# Altium schematic sheet channels_1.schdoc
size 400 x 299 mm; Device: default420x319; Symbol: default420x319; Name: default420x319; Size: "User"; Id: /; File: channels_1; Sheet: /
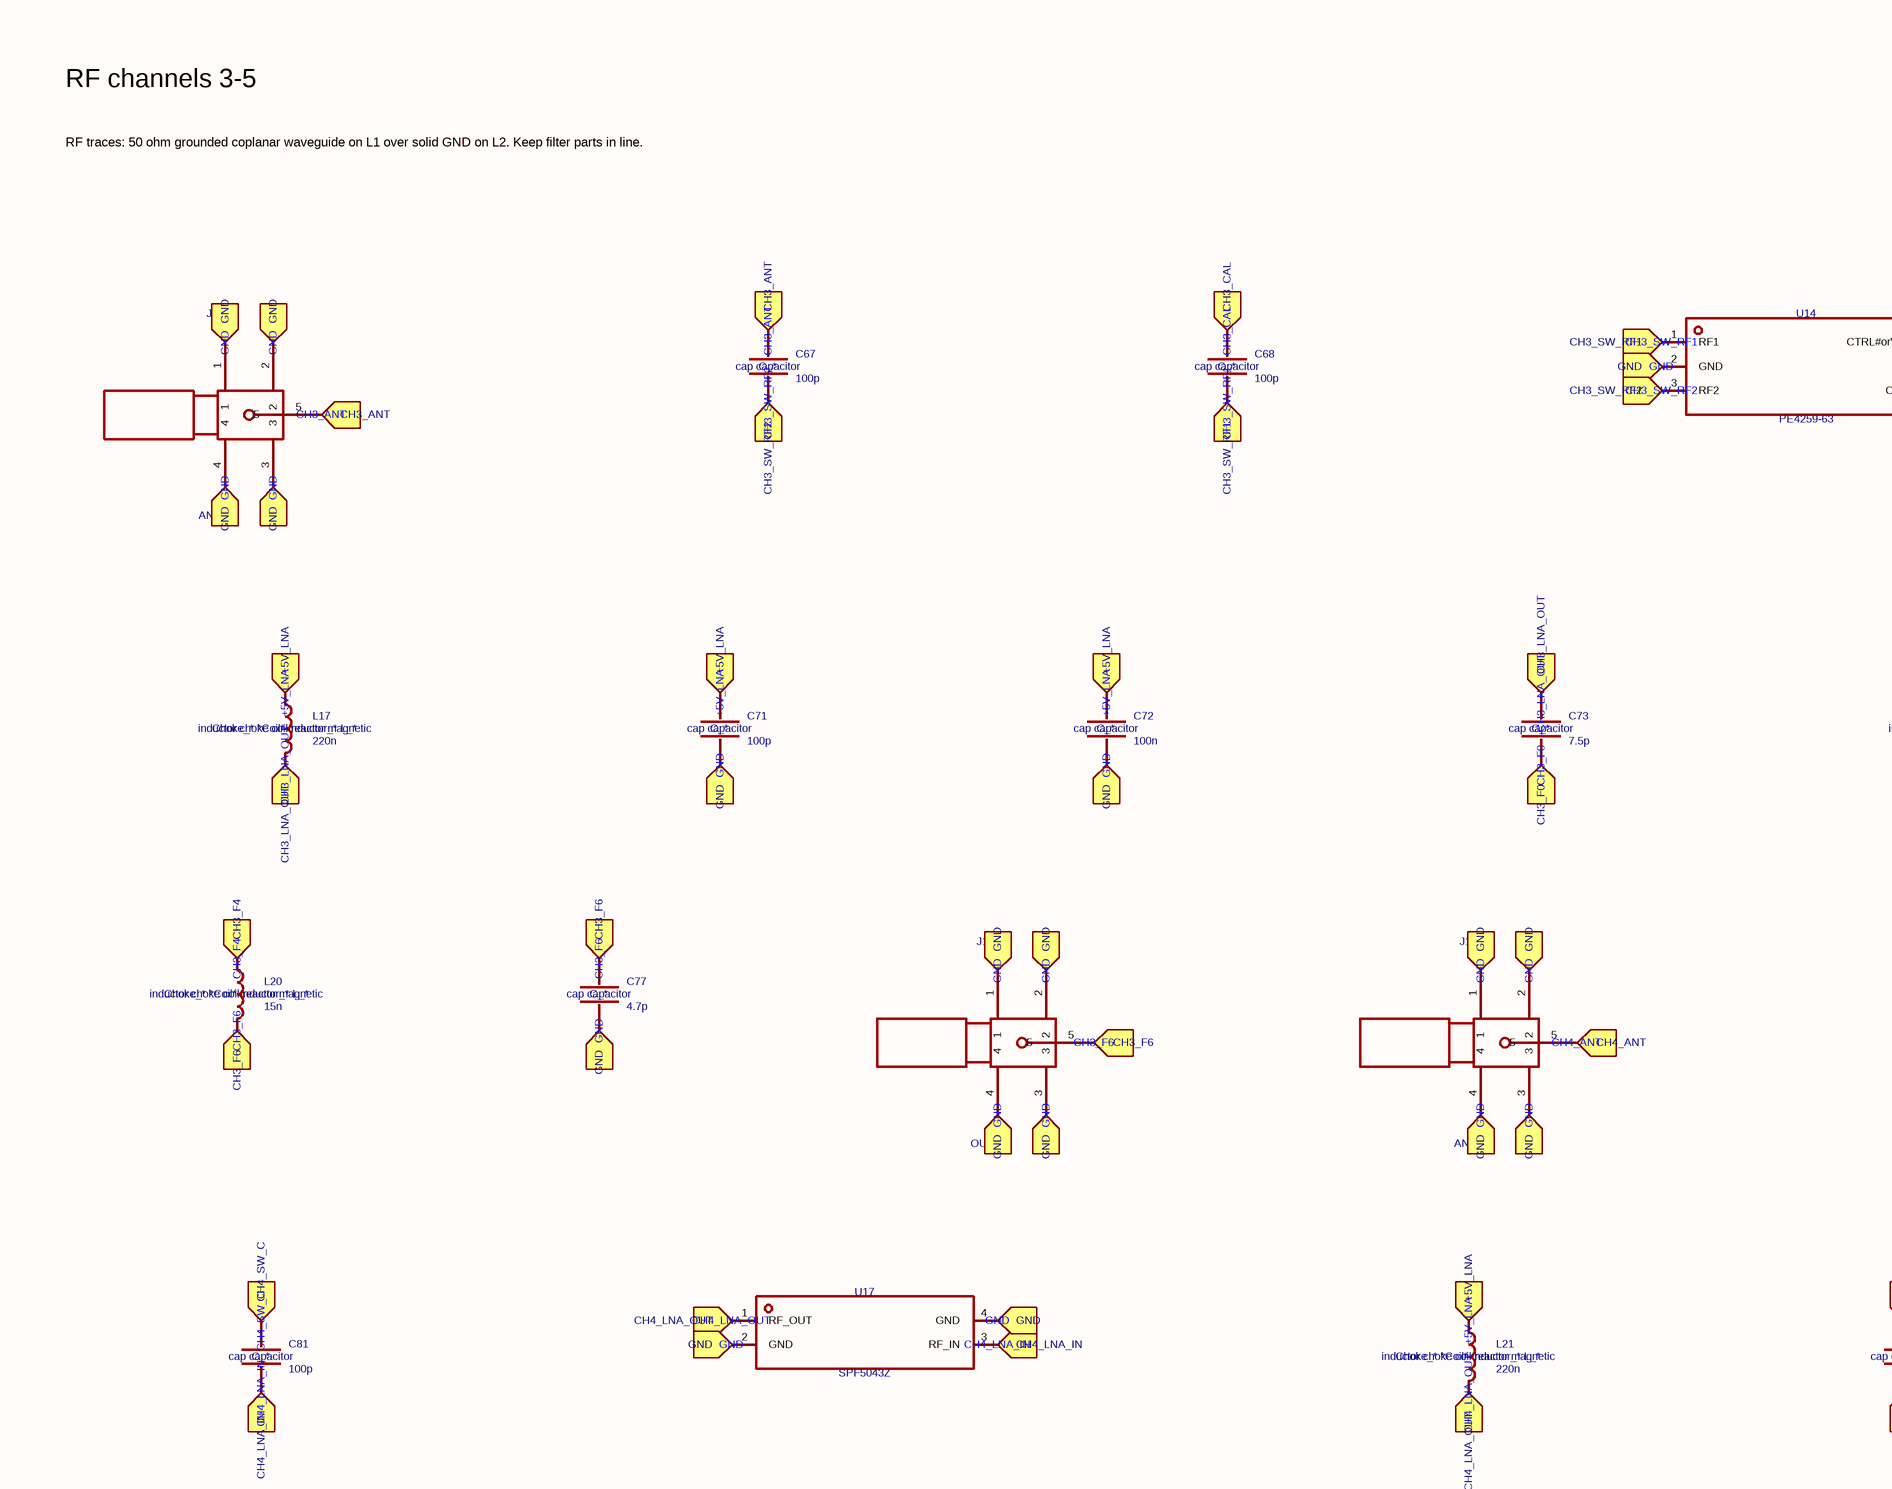
[diagram p0: channels_1.schdoc, top left]
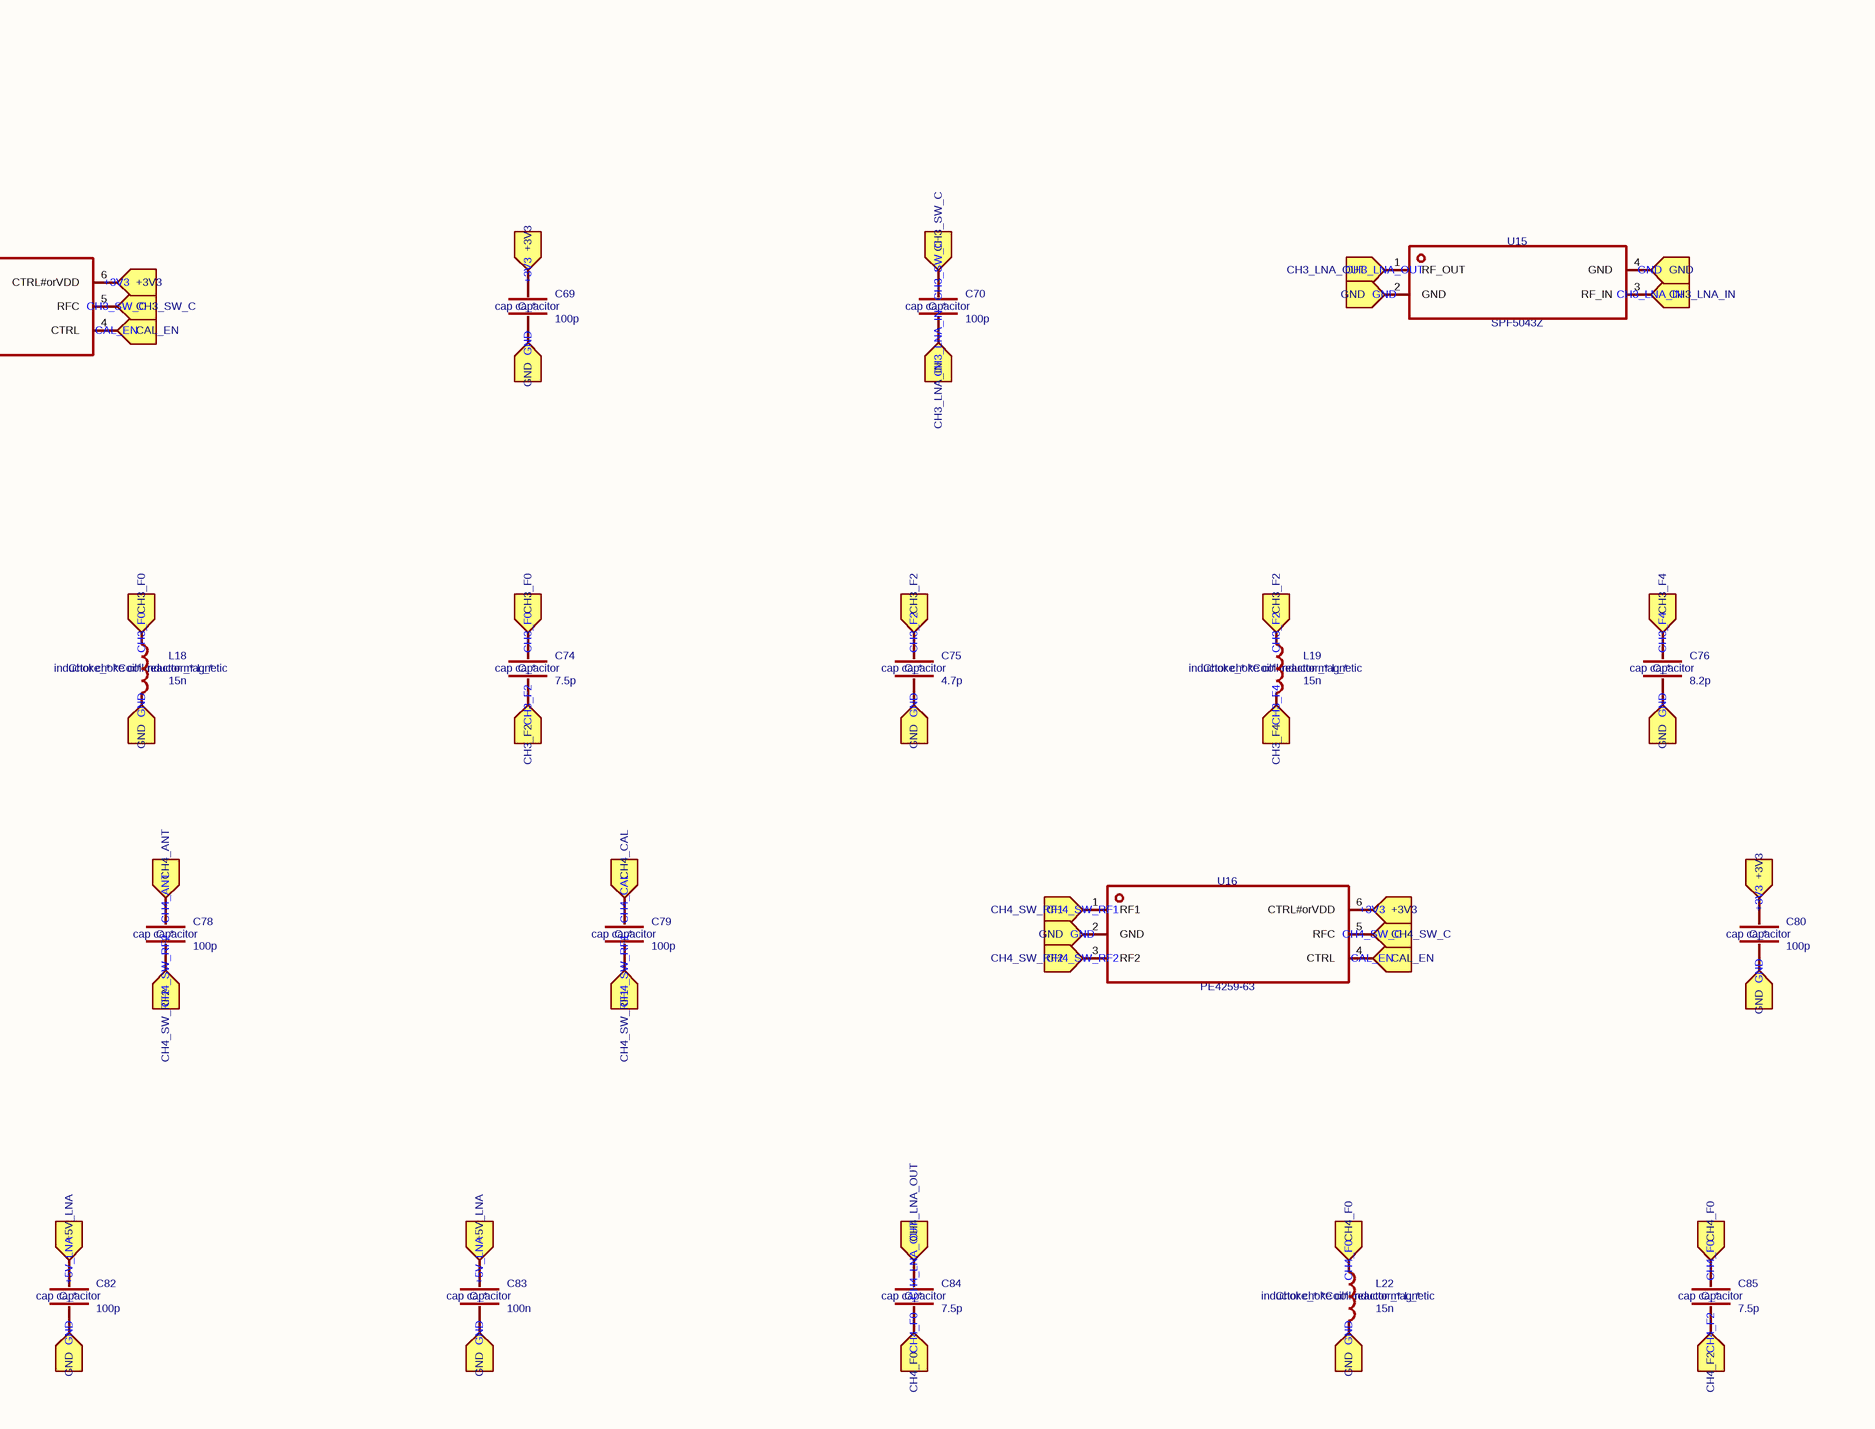
[diagram p1: channels_1.schdoc, top right]
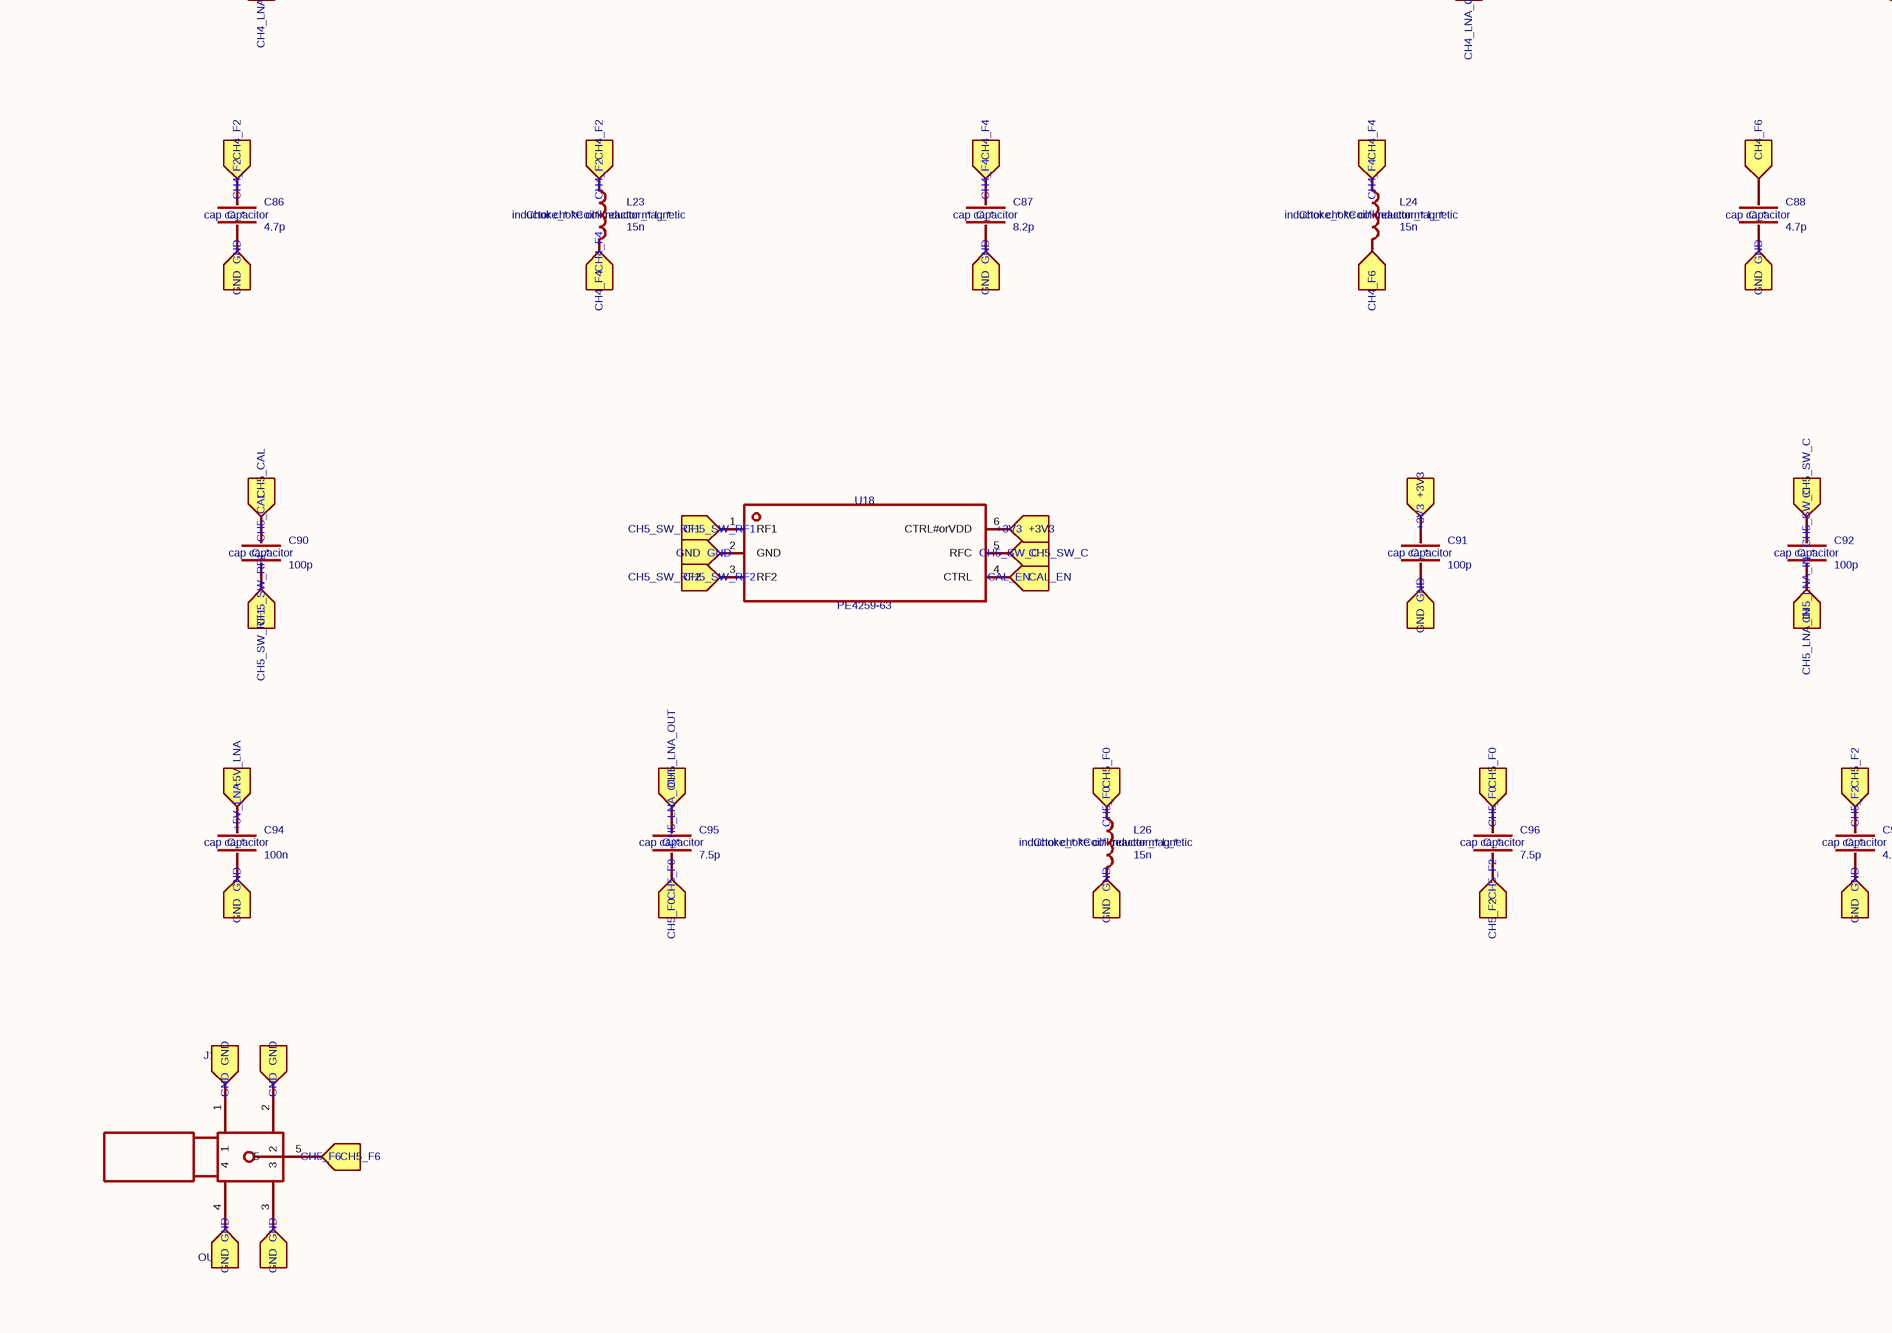
[diagram p2: channels_1.schdoc, bottom left]
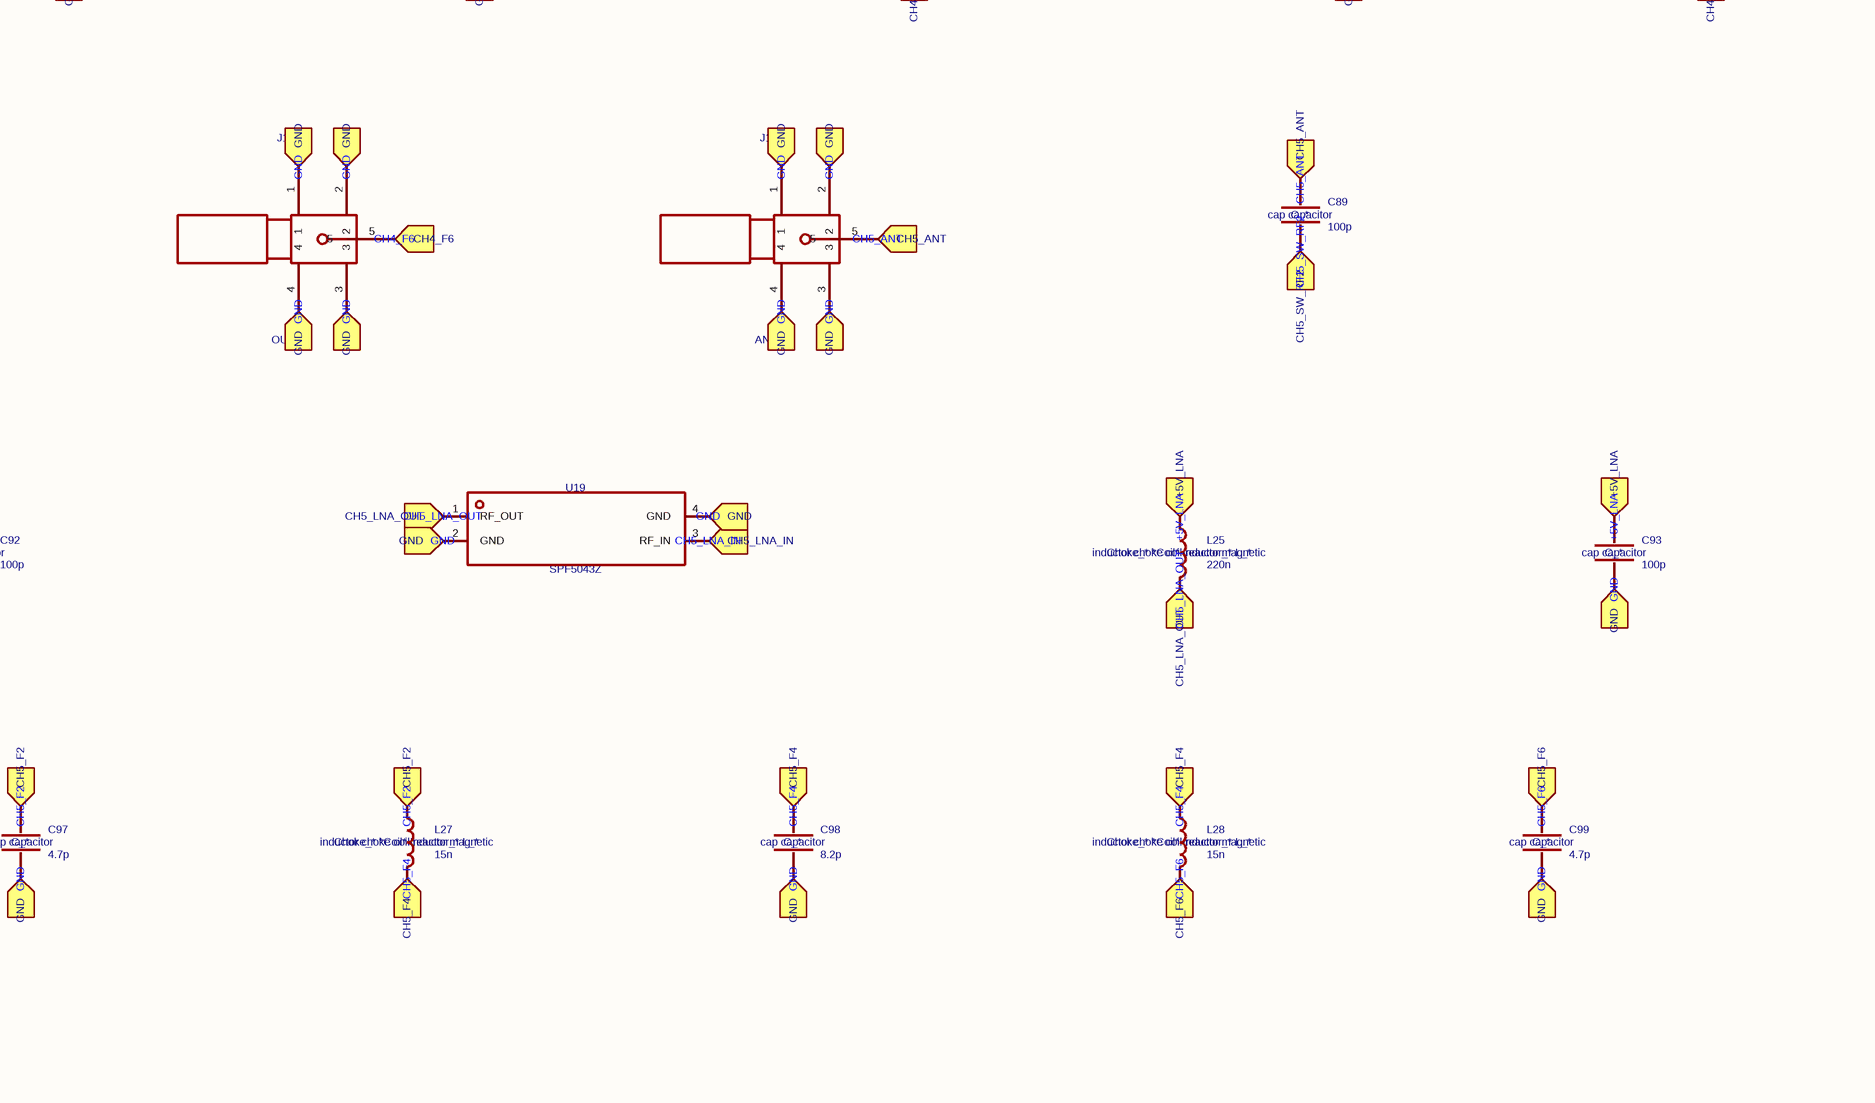
[diagram p3: channels_1.schdoc, bottom right]

## Parts
C67  value 100p  ki_keywords: cap capacitor  ki_fp_filters: C_*  [Capacitor_SMD:C_0402_1005Metric]  (hidden comment: Device_C)
C68  value 100p  ki_keywords: cap capacitor  ki_fp_filters: C_*  [Capacitor_SMD:C_0402_1005Metric]  (hidden comment: Device_C)
C69  value 100p  ki_keywords: cap capacitor  ki_fp_filters: C_*  [Capacitor_SMD:C_0402_1005Metric]  (hidden comment: Device_C)
C70  value 100p  ki_keywords: cap capacitor  ki_fp_filters: C_*  [Capacitor_SMD:C_0402_1005Metric]  (hidden comment: Device_C)
C71  value 100p  ki_keywords: cap capacitor  ki_fp_filters: C_*  [Capacitor_SMD:C_0402_1005Metric]  (hidden comment: Device_C)
C72  value 100n  ki_keywords: cap capacitor  ki_fp_filters: C_*  [Capacitor_SMD:C_0402_1005Metric]  (hidden comment: Device_C)
C73  value 7.5p  ki_keywords: cap capacitor  ki_fp_filters: C_*  [Capacitor_SMD:C_0402_1005Metric]  (hidden comment: Device_C)
C74  value 7.5p  ki_keywords: cap capacitor  ki_fp_filters: C_*  [Capacitor_SMD:C_0402_1005Metric]  (hidden comment: Device_C)
C75  value 4.7p  ki_keywords: cap capacitor  ki_fp_filters: C_*  [Capacitor_SMD:C_0402_1005Metric]  (hidden comment: Device_C)
C76  value 8.2p  ki_keywords: cap capacitor  ki_fp_filters: C_*  [Capacitor_SMD:C_0402_1005Metric]  (hidden comment: Device_C)
C77  value 4.7p  ki_keywords: cap capacitor  ki_fp_filters: C_*  [Capacitor_SMD:C_0402_1005Metric]  (hidden comment: Device_C)
C78  value 100p  ki_keywords: cap capacitor  ki_fp_filters: C_*  [Capacitor_SMD:C_0402_1005Metric]  (hidden comment: Device_C)
C79  value 100p  ki_keywords: cap capacitor  ki_fp_filters: C_*  [Capacitor_SMD:C_0402_1005Metric]  (hidden comment: Device_C)
C80  value 100p  ki_keywords: cap capacitor  ki_fp_filters: C_*  [Capacitor_SMD:C_0402_1005Metric]  (hidden comment: Device_C)
C81  value 100p  ki_keywords: cap capacitor  ki_fp_filters: C_*  [Capacitor_SMD:C_0402_1005Metric]  (hidden comment: Device_C)
C82  value 100p  ki_keywords: cap capacitor  ki_fp_filters: C_*  [Capacitor_SMD:C_0402_1005Metric]  (hidden comment: Device_C)
C83  value 100n  ki_keywords: cap capacitor  ki_fp_filters: C_*  [Capacitor_SMD:C_0402_1005Metric]  (hidden comment: Device_C)
C84  value 7.5p  ki_keywords: cap capacitor  ki_fp_filters: C_*  [Capacitor_SMD:C_0402_1005Metric]  (hidden comment: Device_C)
C85  value 7.5p  ki_keywords: cap capacitor  ki_fp_filters: C_*  [Capacitor_SMD:C_0402_1005Metric]  (hidden comment: Device_C)
C86  value 4.7p  ki_keywords: cap capacitor  ki_fp_filters: C_*  [Capacitor_SMD:C_0402_1005Metric]  (hidden comment: Device_C)
C87  value 8.2p  ki_keywords: cap capacitor  ki_fp_filters: C_*  [Capacitor_SMD:C_0402_1005Metric]  (hidden comment: Device_C)
C88  value 4.7p  ki_keywords: cap capacitor  ki_fp_filters: C_*  [Capacitor_SMD:C_0402_1005Metric]  (hidden comment: Device_C)
C89  value 100p  ki_keywords: cap capacitor  ki_fp_filters: C_*  [Capacitor_SMD:C_0402_1005Metric]  (hidden comment: Device_C)
C90  value 100p  ki_keywords: cap capacitor  ki_fp_filters: C_*  [Capacitor_SMD:C_0402_1005Metric]  (hidden comment: Device_C)
C91  value 100p  ki_keywords: cap capacitor  ki_fp_filters: C_*  [Capacitor_SMD:C_0402_1005Metric]  (hidden comment: Device_C)
C92  value 100p  ki_keywords: cap capacitor  ki_fp_filters: C_*  [Capacitor_SMD:C_0402_1005Metric]  (hidden comment: Device_C)
C93  value 100p  ki_keywords: cap capacitor  ki_fp_filters: C_*  [Capacitor_SMD:C_0402_1005Metric]  (hidden comment: Device_C)
C94  value 100n  ki_keywords: cap capacitor  ki_fp_filters: C_*  [Capacitor_SMD:C_0402_1005Metric]  (hidden comment: Device_C)
C95  value 7.5p  ki_keywords: cap capacitor  ki_fp_filters: C_*  [Capacitor_SMD:C_0402_1005Metric]  (hidden comment: Device_C)
C96  value 7.5p  ki_keywords: cap capacitor  ki_fp_filters: C_*  [Capacitor_SMD:C_0402_1005Metric]  (hidden comment: Device_C)
C97  value 4.7p  ki_keywords: cap capacitor  ki_fp_filters: C_*  [Capacitor_SMD:C_0402_1005Metric]  (hidden comment: Device_C)
C98  value 8.2p  ki_keywords: cap capacitor  ki_fp_filters: C_*  [Capacitor_SMD:C_0402_1005Metric]  (hidden comment: Device_C)
C99  value 4.7p  ki_keywords: cap capacitor  ki_fp_filters: C_*  [Capacitor_SMD:C_0402_1005Metric]  (hidden comment: Device_C)
J9  value ANT3  [prc:SMA-TH_BWSMA-KE-Z001]  (hidden comment: prc_BWSMA-KE-Z001)
J10  value OUT3  [prc:SMA-TH_BWSMA-KE-Z001]  (hidden comment: prc_BWSMA-KE-Z001)
J11  value ANT4  [prc:SMA-TH_BWSMA-KE-Z001]  (hidden comment: prc_BWSMA-KE-Z001)
J12  value OUT4  [prc:SMA-TH_BWSMA-KE-Z001]  (hidden comment: prc_BWSMA-KE-Z001)
J13  value ANT5  [prc:SMA-TH_BWSMA-KE-Z001]  (hidden comment: prc_BWSMA-KE-Z001)
J14  value OUT5  [prc:SMA-TH_BWSMA-KE-Z001]  (hidden comment: prc_BWSMA-KE-Z001)
L17  value 220n  ki_keywords: inductor choke coil reactor magnetic  ki_fp_filters: Choke_* *Coil* Inductor_* L_*  [Inductor_SMD:L_0603_1608Metric]  (hidden comment: Device_L)
L18  value 15n  ki_keywords: inductor choke coil reactor magnetic  ki_fp_filters: Choke_* *Coil* Inductor_* L_*  [Inductor_SMD:L_0402_1005Metric]  (hidden comment: Device_L)
L19  value 15n  ki_keywords: inductor choke coil reactor magnetic  ki_fp_filters: Choke_* *Coil* Inductor_* L_*  [Inductor_SMD:L_0402_1005Metric]  (hidden comment: Device_L)
L20  value 15n  ki_keywords: inductor choke coil reactor magnetic  ki_fp_filters: Choke_* *Coil* Inductor_* L_*  [Inductor_SMD:L_0402_1005Metric]  (hidden comment: Device_L)
L21  value 220n  ki_keywords: inductor choke coil reactor magnetic  ki_fp_filters: Choke_* *Coil* Inductor_* L_*  [Inductor_SMD:L_0603_1608Metric]  (hidden comment: Device_L)
L22  value 15n  ki_keywords: inductor choke coil reactor magnetic  ki_fp_filters: Choke_* *Coil* Inductor_* L_*  [Inductor_SMD:L_0402_1005Metric]  (hidden comment: Device_L)
L23  value 15n  ki_keywords: inductor choke coil reactor magnetic  ki_fp_filters: Choke_* *Coil* Inductor_* L_*  [Inductor_SMD:L_0402_1005Metric]  (hidden comment: Device_L)
L24  value 15n  ki_keywords: inductor choke coil reactor magnetic  ki_fp_filters: Choke_* *Coil* Inductor_* L_*  [Inductor_SMD:L_0402_1005Metric]  (hidden comment: Device_L)
L25  value 220n  ki_keywords: inductor choke coil reactor magnetic  ki_fp_filters: Choke_* *Coil* Inductor_* L_*  [Inductor_SMD:L_0603_1608Metric]  (hidden comment: Device_L)
L26  value 15n  ki_keywords: inductor choke coil reactor magnetic  ki_fp_filters: Choke_* *Coil* Inductor_* L_*  [Inductor_SMD:L_0402_1005Metric]  (hidden comment: Device_L)
L27  value 15n  ki_keywords: inductor choke coil reactor magnetic  ki_fp_filters: Choke_* *Coil* Inductor_* L_*  [Inductor_SMD:L_0402_1005Metric]  (hidden comment: Device_L)
L28  value 15n  ki_keywords: inductor choke coil reactor magnetic  ki_fp_filters: Choke_* *Coil* Inductor_* L_*  [Inductor_SMD:L_0402_1005Metric]  (hidden comment: Device_L)
U14  value PE4259-63  [prc:SC-70-6_L2.2-W1.3-P0.65-LS2.1-BL]  (hidden comment: prc_PE4259-63)
U15  value SPF5043Z  [prc:SOT343_L2.0-W1.3-P1.30-LS2.1-BL]  (hidden comment: prc_SPF5043Z)
U16  value PE4259-63  [prc:SC-70-6_L2.2-W1.3-P0.65-LS2.1-BL]  (hidden comment: prc_PE4259-63)
U17  value SPF5043Z  [prc:SOT343_L2.0-W1.3-P1.30-LS2.1-BL]  (hidden comment: prc_SPF5043Z)
U18  value PE4259-63  [prc:SC-70-6_L2.2-W1.3-P0.65-LS2.1-BL]  (hidden comment: prc_PE4259-63)
U19  value SPF5043Z  [prc:SOT343_L2.0-W1.3-P1.30-LS2.1-BL]  (hidden comment: prc_SPF5043Z)

## Ports
+3V3 (in), +5V_LNA (in), CAL_EN (in), CH3_ANT (in), CH3_CAL (in), CH3_F0 (in), CH3_F2 (in), CH3_F4 (in), CH3_F6 (in), CH3_LNA_IN (in), CH3_LNA_OUT (in), CH3_SW_C (in), CH3_SW_RF1 (in), CH3_SW_RF2 (in), CH4_ANT (in), CH4_CAL (in), CH4_F0 (in), CH4_F2 (in), CH4_F4 (in), CH4_F6 (in), CH4_LNA_IN (in), CH4_LNA_OUT (in), CH4_SW_C (in), CH4_SW_RF1 (in), CH4_SW_RF2 (in), CH5_ANT (in), CH5_CAL (in), CH5_F0 (in), CH5_F2 (in), CH5_F4 (in), CH5_F6 (in), CH5_LNA_IN (in), CH5_LNA_OUT (in), CH5_SW_C (in), CH5_SW_RF1 (in), CH5_SW_RF2 (in), GND (in)

## Nets
+3V3: C69.1 C80.1 C91.1 U14.6(CTRL#orVDD) U16.6(CTRL#orVDD) U18.6(CTRL#orVDD) ; port +3V3
+5V_LNA: C71.1 C72.1 C82.1 C83.1 C93.1 C94.1 L17.1 L21.1 L25.1 ; port +5V_LNA
CAL_EN: U14.4(CTRL) U16.4(CTRL) U18.4(CTRL) ; port CAL_EN
CH3_ANT: C67.1 J9.5 ; port CH3_ANT
CH3_CAL: C68.1 ; port CH3_CAL
CH3_F0: C73.2 C74.1 L18.1 ; port CH3_F0
CH3_F2: C74.2 C75.1 L19.1 ; port CH3_F2
CH3_F4: C76.1 L19.2 L20.1 ; port CH3_F4
CH3_F6: C77.1 J10.5 L20.2 ; port CH3_F6
CH3_LNA_IN: C70.2 U15.3(RF_IN) ; port CH3_LNA_IN
CH3_LNA_OUT: C73.1 L17.2 U15.1(RF_OUT) ; port CH3_LNA_OUT
CH3_SW_C: C70.1 U14.5(RFC) ; port CH3_SW_C
CH3_SW_RF1: C68.2 U14.1(RF1) ; port CH3_SW_RF1
CH3_SW_RF2: C67.2 U14.3(RF2) ; port CH3_SW_RF2
CH4_ANT: C78.1 J11.5 ; port CH4_ANT
CH4_CAL: C79.1 ; port CH4_CAL
CH4_F0: C84.2 C85.1 L22.1 ; port CH4_F0
CH4_F2: C85.2 C86.1 L23.1 ; port CH4_F2
CH4_F4: C87.1 L23.2 L24.1 ; port CH4_F4
CH4_F6: C88.1 J12.5 L24.2 ; port CH4_F6
CH4_LNA_IN: C81.2 U17.3(RF_IN) ; port CH4_LNA_IN
CH4_LNA_OUT: C84.1 L21.2 U17.1(RF_OUT) ; port CH4_LNA_OUT
CH4_SW_C: C81.1 U16.5(RFC) ; port CH4_SW_C
CH4_SW_RF1: C79.2 U16.1(RF1) ; port CH4_SW_RF1
CH4_SW_RF2: C78.2 U16.3(RF2) ; port CH4_SW_RF2
CH5_ANT: C89.1 J13.5 ; port CH5_ANT
CH5_CAL: C90.1 ; port CH5_CAL
CH5_F0: C95.2 C96.1 L26.1 ; port CH5_F0
CH5_F2: C96.2 C97.1 L27.1 ; port CH5_F2
CH5_F4: C98.1 L27.2 L28.1 ; port CH5_F4
CH5_F6: C99.1 J14.5 L28.2 ; port CH5_F6
CH5_LNA_IN: C92.2 U19.3(RF_IN) ; port CH5_LNA_IN
CH5_LNA_OUT: C95.1 L25.2 U19.1(RF_OUT) ; port CH5_LNA_OUT
CH5_SW_C: C92.1 U18.5(RFC) ; port CH5_SW_C
CH5_SW_RF1: C90.2 U18.1(RF1) ; port CH5_SW_RF1
CH5_SW_RF2: C89.2 U18.3(RF2) ; port CH5_SW_RF2
GND: C69.2 C71.2 C72.2 C75.2 C76.2 C77.2 C80.2 C82.2 C83.2 C86.2 C87.2 C88.2 C91.2 C93.2 C94.2 C97.2 C98.2 C99.2 J9.1 J9.2 J9.3 J9.4 J10.1 J10.2 J10.3 J10.4 J11.1 J11.2 J11.3 J11.4 J12.1 J12.2 J12.3 J12.4 J13.1 J13.2 J13.3 J13.4 J14.1 J14.2 J14.3 J14.4 L18.2 L22.2 L26.2 U14.2(GND) U15.2(GND) U15.4(GND) U16.2(GND) U17.2(GND) U17.4(GND) U18.2(GND) U19.2(GND) U19.4(GND) ; port GND

## Notes on the sheet
- RF channels 3-5
- RF traces: 50 ohm grounded coplanar waveguide on L1 over solid GND on L2. Keep filter parts in line.
- 1
- 2
- 3
- 4
- 5
- 6
- 7
- 8
- A
- B
- C
- D
- E
- F
- Size:"User"
- Title:
- File:channels_1
- Sheet:/
- Date:
- Rev:
- Id:/

## Library data of the parts
C67 = Device_C: UniqueId: 790facc1dd52bc03; KiLib_Generator: SMD_2terminal_chip_molded; AddInBom: yes; Device: Device_C; Symbol: Device_C; FootprintName: Capacitor_SMD:C_0402_1005Metric
C68 = Device_C: UniqueId: 695de859447a278b; KiLib_Generator: SMD_2terminal_chip_molded; AddInBom: yes; Device: Device_C; Symbol: Device_C; FootprintName: Capacitor_SMD:C_0402_1005Metric
C69 = Device_C: UniqueId: ed5e3f159d100c7c; KiLib_Generator: SMD_2terminal_chip_molded; AddInBom: yes; Device: Device_C; Symbol: Device_C; FootprintName: Capacitor_SMD:C_0402_1005Metric
C70 = Device_C: UniqueId: ef22f62b38d240f9; KiLib_Generator: SMD_2terminal_chip_molded; AddInBom: yes; Device: Device_C; Symbol: Device_C; FootprintName: Capacitor_SMD:C_0402_1005Metric
C71 = Device_C: UniqueId: 13c458815c86755b; KiLib_Generator: SMD_2terminal_chip_molded; AddInBom: yes; Device: Device_C; Symbol: Device_C; FootprintName: Capacitor_SMD:C_0402_1005Metric
C72 = Device_C: UniqueId: 4c445f6b18a98c19; KiLib_Generator: SMD_2terminal_chip_molded; AddInBom: yes; Device: Device_C; Symbol: Device_C; LCSC: C1525; FootprintName: Capacitor_SMD:C_0402_1005Metric
C73 = Device_C: UniqueId: ed67743022cf1596; KiLib_Generator: SMD_2terminal_chip_molded; AddInBom: yes; Device: Device_C; Symbol: Device_C; FootprintName: Capacitor_SMD:C_0402_1005Metric
C74 = Device_C: UniqueId: 428606a84a8f4e02; KiLib_Generator: SMD_2terminal_chip_molded; AddInBom: yes; Device: Device_C; Symbol: Device_C; FootprintName: Capacitor_SMD:C_0402_1005Metric
C75 = Device_C: UniqueId: 94802851accbed84; KiLib_Generator: SMD_2terminal_chip_molded; AddInBom: yes; Device: Device_C; Symbol: Device_C; FootprintName: Capacitor_SMD:C_0402_1005Metric
C76 = Device_C: UniqueId: e46c4319d3798579; KiLib_Generator: SMD_2terminal_chip_molded; AddInBom: yes; Device: Device_C; Symbol: Device_C; FootprintName: Capacitor_SMD:C_0402_1005Metric
C77 = Device_C: UniqueId: d85eccf1df583bf1; KiLib_Generator: SMD_2terminal_chip_molded; AddInBom: yes; Device: Device_C; Symbol: Device_C; FootprintName: Capacitor_SMD:C_0402_1005Metric
C78 = Device_C: UniqueId: 289a7498a46a83c5; KiLib_Generator: SMD_2terminal_chip_molded; AddInBom: yes; Device: Device_C; Symbol: Device_C; FootprintName: Capacitor_SMD:C_0402_1005Metric
C79 = Device_C: UniqueId: 1d1687b72a359977; KiLib_Generator: SMD_2terminal_chip_molded; AddInBom: yes; Device: Device_C; Symbol: Device_C; FootprintName: Capacitor_SMD:C_0402_1005Metric
C80 = Device_C: UniqueId: 2dbd9816442fdb9a; KiLib_Generator: SMD_2terminal_chip_molded; AddInBom: yes; Device: Device_C; Symbol: Device_C; FootprintName: Capacitor_SMD:C_0402_1005Metric
C81 = Device_C: UniqueId: bdf2686215596067; KiLib_Generator: SMD_2terminal_chip_molded; AddInBom: yes; Device: Device_C; Symbol: Device_C; FootprintName: Capacitor_SMD:C_0402_1005Metric
C82 = Device_C: UniqueId: 2ac4a713bdb27458; KiLib_Generator: SMD_2terminal_chip_molded; AddInBom: yes; Device: Device_C; Symbol: Device_C; FootprintName: Capacitor_SMD:C_0402_1005Metric
C83 = Device_C: UniqueId: 2b2365c2d0e3ae99; KiLib_Generator: SMD_2terminal_chip_molded; AddInBom: yes; Device: Device_C; Symbol: Device_C; LCSC: C1525; FootprintName: Capacitor_SMD:C_0402_1005Metric
C84 = Device_C: UniqueId: ac7cf9eb5671d2c3; KiLib_Generator: SMD_2terminal_chip_molded; AddInBom: yes; Device: Device_C; Symbol: Device_C; FootprintName: Capacitor_SMD:C_0402_1005Metric
C85 = Device_C: UniqueId: 6158349470ed1956; KiLib_Generator: SMD_2terminal_chip_molded; AddInBom: yes; Device: Device_C; Symbol: Device_C; FootprintName: Capacitor_SMD:C_0402_1005Metric
C86 = Device_C: UniqueId: 043006a40a259ae3; KiLib_Generator: SMD_2terminal_chip_molded; AddInBom: yes; Device: Device_C; Symbol: Device_C; FootprintName: Capacitor_SMD:C_0402_1005Metric
C87 = Device_C: UniqueId: ed052c5890e059ff; KiLib_Generator: SMD_2terminal_chip_molded; AddInBom: yes; Device: Device_C; Symbol: Device_C; FootprintName: Capacitor_SMD:C_0402_1005Metric
C88 = Device_C: UniqueId: 909660952e1a96fd; KiLib_Generator: SMD_2terminal_chip_molded; AddInBom: yes; Device: Device_C; Symbol: Device_C; FootprintName: Capacitor_SMD:C_0402_1005Metric
C89 = Device_C: UniqueId: f9bfd7a6531d354d; KiLib_Generator: SMD_2terminal_chip_molded; AddInBom: yes; Device: Device_C; Symbol: Device_C; FootprintName: Capacitor_SMD:C_0402_1005Metric
C90 = Device_C: UniqueId: 5471cb5e6ead650e; KiLib_Generator: SMD_2terminal_chip_molded; AddInBom: yes; Device: Device_C; Symbol: Device_C; FootprintName: Capacitor_SMD:C_0402_1005Metric
C91 = Device_C: UniqueId: de488198406d19e5; KiLib_Generator: SMD_2terminal_chip_molded; AddInBom: yes; Device: Device_C; Symbol: Device_C; FootprintName: Capacitor_SMD:C_0402_1005Metric
C92 = Device_C: UniqueId: 7abe426619a81940; KiLib_Generator: SMD_2terminal_chip_molded; AddInBom: yes; Device: Device_C; Symbol: Device_C; FootprintName: Capacitor_SMD:C_0402_1005Metric
C93 = Device_C: UniqueId: ecf0d2211b923647; KiLib_Generator: SMD_2terminal_chip_molded; AddInBom: yes; Device: Device_C; Symbol: Device_C; FootprintName: Capacitor_SMD:C_0402_1005Metric
C94 = Device_C: UniqueId: 7c9a59bbe2a187d0; KiLib_Generator: SMD_2terminal_chip_molded; AddInBom: yes; Device: Device_C; Symbol: Device_C; LCSC: C1525; FootprintName: Capacitor_SMD:C_0402_1005Metric
C95 = Device_C: UniqueId: 57cde6634fc67369; KiLib_Generator: SMD_2terminal_chip_molded; AddInBom: yes; Device: Device_C; Symbol: Device_C; FootprintName: Capacitor_SMD:C_0402_1005Metric
C96 = Device_C: UniqueId: 31c7e7eccc20d384; KiLib_Generator: SMD_2terminal_chip_molded; AddInBom: yes; Device: Device_C; Symbol: Device_C; FootprintName: Capacitor_SMD:C_0402_1005Metric
C97 = Device_C: UniqueId: d8febf21116de1ec; KiLib_Generator: SMD_2terminal_chip_molded; AddInBom: yes; Device: Device_C; Symbol: Device_C; FootprintName: Capacitor_SMD:C_0402_1005Metric
C98 = Device_C: UniqueId: d804bee1c3c181f9; KiLib_Generator: SMD_2terminal_chip_molded; AddInBom: yes; Device: Device_C; Symbol: Device_C; FootprintName: Capacitor_SMD:C_0402_1005Metric
C99 = Device_C: UniqueId: adaa631d027ba959; KiLib_Generator: SMD_2terminal_chip_molded; AddInBom: yes; Device: Device_C; Symbol: Device_C; FootprintName: Capacitor_SMD:C_0402_1005Metric
J9 = prc_BWSMA-KE-Z001: Manufacturer: BAT WIRELESS(蝙蝠无线); ki_keywords: RF Connectors / Coaxial Connectors; UniqueId: 14b2f8436ec73be4; AddInBom: yes; Device: prc_BWSMA-KE-Z001; Symbol: prc_BWSMA-KE-Z001; UserDocLink: https://lcsc.com/product-detail/New-Arrivals_BAT-WIRELESS-BWSMA-KE-Z001_C496549.html; LCSC: C496549; MPN: BWSMA-KE-Z001; LCSC Part: C496549; FootprintName: prc:SMA-TH_BWSMA-KE-Z001
J10 = prc_BWSMA-KE-Z001: Manufacturer: BAT WIRELESS(蝙蝠无线); ki_keywords: RF Connectors / Coaxial Connectors; UniqueId: 19810ed2731c20b4; AddInBom: yes; Device: prc_BWSMA-KE-Z001; Symbol: prc_BWSMA-KE-Z001; UserDocLink: https://lcsc.com/product-detail/New-Arrivals_BAT-WIRELESS-BWSMA-KE-Z001_C496549.html; LCSC: C496549; MPN: BWSMA-KE-Z001; LCSC Part: C496549; FootprintName: prc:SMA-TH_BWSMA-KE-Z001
J11 = prc_BWSMA-KE-Z001: Manufacturer: BAT WIRELESS(蝙蝠无线); ki_keywords: RF Connectors / Coaxial Connectors; UniqueId: d9503b6182e86bda; AddInBom: yes; Device: prc_BWSMA-KE-Z001; Symbol: prc_BWSMA-KE-Z001; UserDocLink: https://lcsc.com/product-detail/New-Arrivals_BAT-WIRELESS-BWSMA-KE-Z001_C496549.html; LCSC: C496549; MPN: BWSMA-KE-Z001; LCSC Part: C496549; FootprintName: prc:SMA-TH_BWSMA-KE-Z001
J12 = prc_BWSMA-KE-Z001: Manufacturer: BAT WIRELESS(蝙蝠无线); ki_keywords: RF Connectors / Coaxial Connectors; UniqueId: 81192a87cd4e0892; AddInBom: yes; Device: prc_BWSMA-KE-Z001; Symbol: prc_BWSMA-KE-Z001; UserDocLink: https://lcsc.com/product-detail/New-Arrivals_BAT-WIRELESS-BWSMA-KE-Z001_C496549.html; LCSC: C496549; MPN: BWSMA-KE-Z001; LCSC Part: C496549; FootprintName: prc:SMA-TH_BWSMA-KE-Z001
J13 = prc_BWSMA-KE-Z001: Manufacturer: BAT WIRELESS(蝙蝠无线); ki_keywords: RF Connectors / Coaxial Connectors; UniqueId: 4fb97ddf9141d37a; AddInBom: yes; Device: prc_BWSMA-KE-Z001; Symbol: prc_BWSMA-KE-Z001; UserDocLink: https://lcsc.com/product-detail/New-Arrivals_BAT-WIRELESS-BWSMA-KE-Z001_C496549.html; LCSC: C496549; MPN: BWSMA-KE-Z001; LCSC Part: C496549; FootprintName: prc:SMA-TH_BWSMA-KE-Z001
J14 = prc_BWSMA-KE-Z001: Manufacturer: BAT WIRELESS(蝙蝠无线); ki_keywords: RF Connectors / Coaxial Connectors; UniqueId: d368ede5840df1df; AddInBom: yes; Device: prc_BWSMA-KE-Z001; Symbol: prc_BWSMA-KE-Z001; UserDocLink: https://lcsc.com/product-detail/New-Arrivals_BAT-WIRELESS-BWSMA-KE-Z001_C496549.html; LCSC: C496549; MPN: BWSMA-KE-Z001; LCSC Part: C496549; FootprintName: prc:SMA-TH_BWSMA-KE-Z001
L17 = Device_L: UniqueId: 4e2cc9cdfaace8bd; KiLib_Generator: SMD_2terminal_chip_molded; AddInBom: yes; Device: Device_L; Symbol: Device_L; FootprintName: Inductor_SMD:L_0603_1608Metric
L18 = Device_L: UniqueId: ef274dca6664bd94; KiLib_Generator: SMD_2terminal_chip_molded; AddInBom: yes; Device: Device_L; Symbol: Device_L; FootprintName: Inductor_SMD:L_0402_1005Metric
L19 = Device_L: UniqueId: c2f96dd3d1060b29; KiLib_Generator: SMD_2terminal_chip_molded; AddInBom: yes; Device: Device_L; Symbol: Device_L; FootprintName: Inductor_SMD:L_0402_1005Metric
L20 = Device_L: UniqueId: 33d739b5b19e2cc1; KiLib_Generator: SMD_2terminal_chip_molded; AddInBom: yes; Device: Device_L; Symbol: Device_L; FootprintName: Inductor_SMD:L_0402_1005Metric
L21 = Device_L: UniqueId: d6084f5f3856b55f; KiLib_Generator: SMD_2terminal_chip_molded; AddInBom: yes; Device: Device_L; Symbol: Device_L; FootprintName: Inductor_SMD:L_0603_1608Metric
L22 = Device_L: UniqueId: fed822e2111ce1a4; KiLib_Generator: SMD_2terminal_chip_molded; AddInBom: yes; Device: Device_L; Symbol: Device_L; FootprintName: Inductor_SMD:L_0402_1005Metric
L23 = Device_L: UniqueId: 10a0d6a7e42e00c6; KiLib_Generator: SMD_2terminal_chip_molded; AddInBom: yes; Device: Device_L; Symbol: Device_L; FootprintName: Inductor_SMD:L_0402_1005Metric
L24 = Device_L: UniqueId: 097f1e3fae8960a0; KiLib_Generator: SMD_2terminal_chip_molded; AddInBom: yes; Device: Device_L; Symbol: Device_L; FootprintName: Inductor_SMD:L_0402_1005Metric
L25 = Device_L: UniqueId: 2c0db95e7e518774; KiLib_Generator: SMD_2terminal_chip_molded; AddInBom: yes; Device: Device_L; Symbol: Device_L; FootprintName: Inductor_SMD:L_0603_1608Metric
L26 = Device_L: UniqueId: 7baa404b977f34c0; KiLib_Generator: SMD_2terminal_chip_molded; AddInBom: yes; Device: Device_L; Symbol: Device_L; FootprintName: Inductor_SMD:L_0402_1005Metric
L27 = Device_L: UniqueId: 9e1fb412f925f5d1; KiLib_Generator: SMD_2terminal_chip_molded; AddInBom: yes; Device: Device_L; Symbol: Device_L; FootprintName: Inductor_SMD:L_0402_1005Metric
L28 = Device_L: UniqueId: 8d3b36ae7104e519; KiLib_Generator: SMD_2terminal_chip_molded; AddInBom: yes; Device: Device_L; Symbol: Device_L; FootprintName: Inductor_SMD:L_0402_1005Metric
U14 = prc_PE4259-63: Manufacturer: pSemi(游隼半导体); ki_keywords: RF Switches; UniqueId: 8791d75d94e1481b; AddInBom: yes; Device: prc_PE4259-63; Symbol: prc_PE4259-63; UserDocLink: https://lcsc.com/product-detail/RF-Switches_PS-PE4259-63_C470892.html; LCSC: C470892; MPN: PE4259-63; LCSC Part: C470892; FootprintName: prc:SC-70-6_L2.2-W1.3-P0.65-LS2.1-BL
U15 = prc_SPF5043Z: Manufacturer: Qorvo; ki_keywords: RF Amplifiers; UniqueId: 28995c53ef78d865; AddInBom: yes; Device: prc_SPF5043Z; Symbol: prc_SPF5043Z; UserDocLink: https://lcsc.com/product-detail/RF-Amplifiers_Qorvo-SPF5043Z_C470902.html; LCSC: C470902; MPN: SPF5043Z; LCSC Part: C470902; FootprintName: prc:SOT343_L2.0-W1.3-P1.30-LS2.1-BL
U16 = prc_PE4259-63: Manufacturer: pSemi(游隼半导体); ki_keywords: RF Switches; UniqueId: ca4d2b64b6ec8380; AddInBom: yes; Device: prc_PE4259-63; Symbol: prc_PE4259-63; UserDocLink: https://lcsc.com/product-detail/RF-Switches_PS-PE4259-63_C470892.html; LCSC: C470892; MPN: PE4259-63; LCSC Part: C470892; FootprintName: prc:SC-70-6_L2.2-W1.3-P0.65-LS2.1-BL
U17 = prc_SPF5043Z: Manufacturer: Qorvo; ki_keywords: RF Amplifiers; UniqueId: 1a5dee1823ef113a; AddInBom: yes; Device: prc_SPF5043Z; Symbol: prc_SPF5043Z; UserDocLink: https://lcsc.com/product-detail/RF-Amplifiers_Qorvo-SPF5043Z_C470902.html; LCSC: C470902; MPN: SPF5043Z; LCSC Part: C470902; FootprintName: prc:SOT343_L2.0-W1.3-P1.30-LS2.1-BL
U18 = prc_PE4259-63: Manufacturer: pSemi(游隼半导体); ki_keywords: RF Switches; UniqueId: 3b01714176430545; AddInBom: yes; Device: prc_PE4259-63; Symbol: prc_PE4259-63; UserDocLink: https://lcsc.com/product-detail/RF-Switches_PS-PE4259-63_C470892.html; LCSC: C470892; MPN: PE4259-63; LCSC Part: C470892; FootprintName: prc:SC-70-6_L2.2-W1.3-P0.65-LS2.1-BL
U19 = prc_SPF5043Z: Manufacturer: Qorvo; ki_keywords: RF Amplifiers; UniqueId: a4a6b0395ae03088; AddInBom: yes; Device: prc_SPF5043Z; Symbol: prc_SPF5043Z; UserDocLink: https://lcsc.com/product-detail/RF-Amplifiers_Qorvo-SPF5043Z_C470902.html; LCSC: C470902; MPN: SPF5043Z; LCSC Part: C470902; FootprintName: prc:SOT343_L2.0-W1.3-P1.30-LS2.1-BL